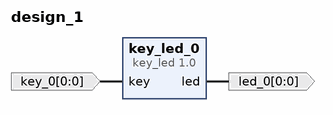
[diagram p0: block diagram of the top level]
# Vivado block design design_1, xc7z020clg400-1, Vivado 2020.2
create_bd_design design_1

create_bd_port -dir I -from 0 -to 0 -type data key_0
create_bd_port -dir O -from 0 -to 0 -type data led_0

create_bd_cell -type ip -vlnv xilinx.com:hls:key_led:1.0 key_led_0

# ---- connections ----

connect_bd_net -net key_0_1 [get_bd_ports key_0] [get_bd_pins key_led_0/key]
connect_bd_net [get_bd_pins key_led_0/led] [get_bd_ports led_0]

validate_bd_design
save_bd_design
